# Altium project Smart_Charger_for_Single_cell_Li-ion_Battery.PrjPcb
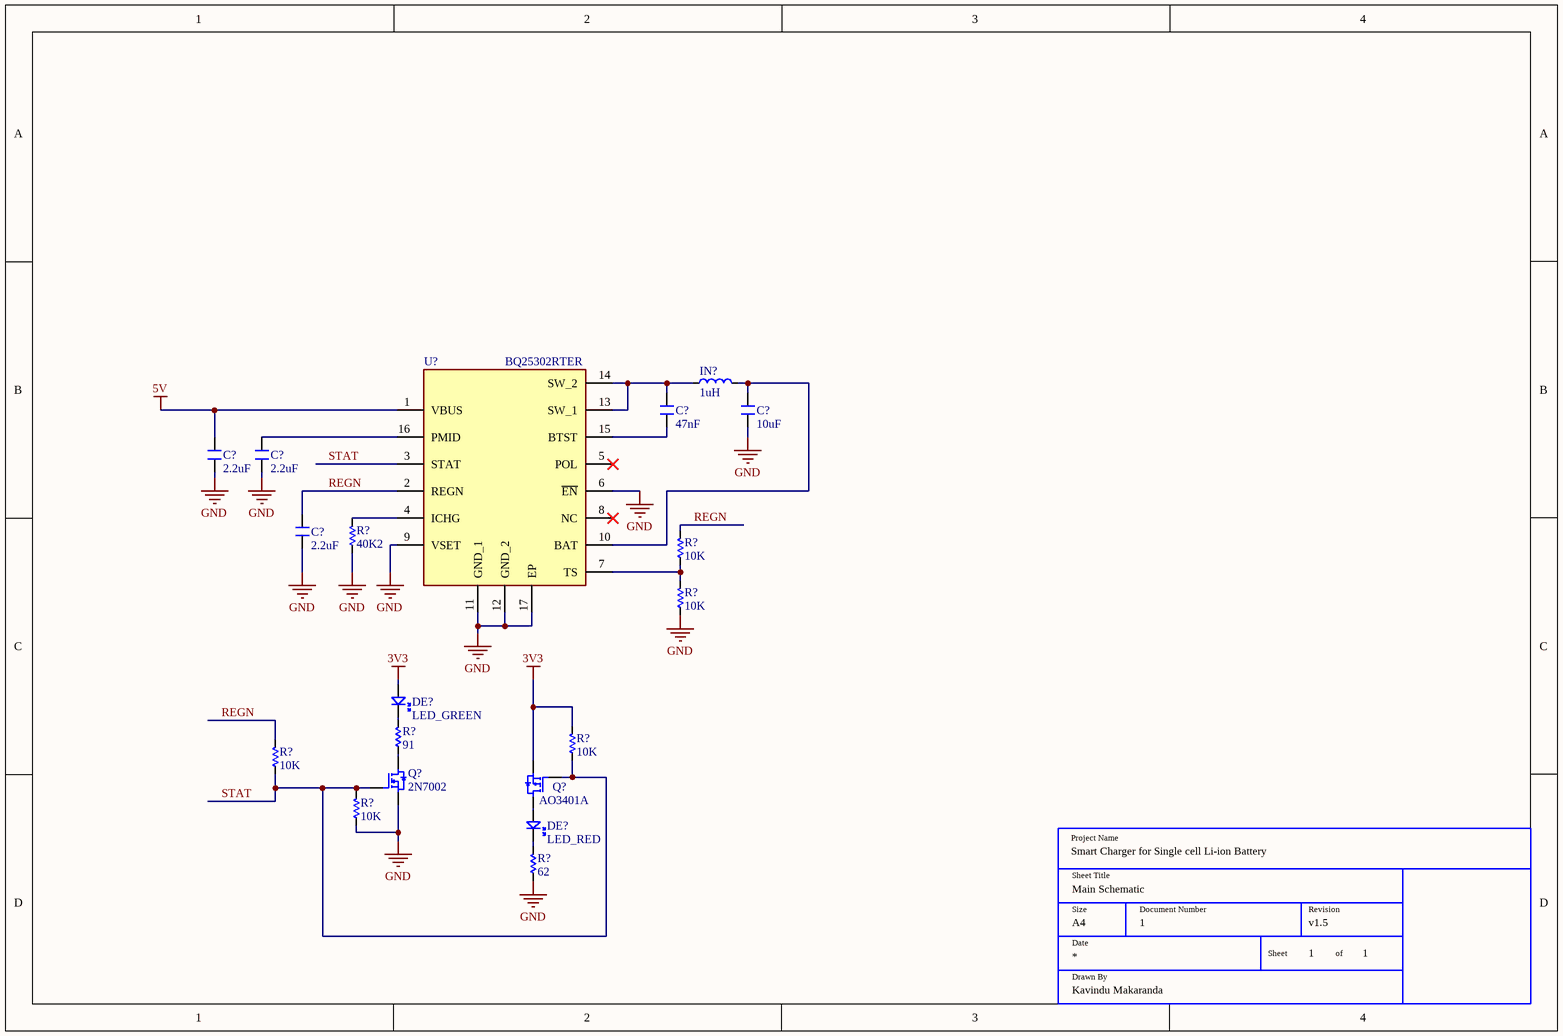
[diagram p0: Sheet1.SchDoc]
Project Name: Smart Charger for Single cell Li-ion Battery
1 sheet, 20 parts. Net scope: global (net labels, ports and power ports of the same name join across sheets).
Board file: PCB.PcbDoc

## Sheet Sheet1.SchDoc: Main Schematic
size A4; DrawnBy: Kavindu Makaranda; DocumentNumber: 1; Revision: v1.5; SheetNumber: 1; SheetTotal: 1; SheetSize: A4

### Parts
(Parts that share a designator on the sheet are numbered #1, #2 ... from top to bottom, then left to right.)
*  Title Box  (value not drawn)  (graphical)
C?#1  47nF  [CAPC1608X08N]
C?#2  10uF  [CAPC2012X14N]
C?#3  2.2uF  [CAPC2012X12N]
C?#4  2.2uF  [CAPC2012X12N]
C?#5  2.2uF  [CAPC2012X12N]
DE?#1  LED_GREEN  [LED_1608X06N]
DE?#2  LED_RED  [LED_1608X06N]
IN?  1uH  [INDC2520X09N]
Q?#1  AO3401A  [SOT95P240X115-3N]
Q?#2  2N7002  [SOT95P240X115-3N]
R?#1  40K2  [RESC1005X04N]
R?#2  10K  [RESC1005X04N]
R?#3  10K  [RESC1005X04N]
R?#4  91  [RESC1005X04N]
R?#5  10K  [RESC1005X04N]
R?#6  10K  [RESC1005X04N]
R?#7  10K  [RESC1005X04N]
R?#8  62  [RESC1005X04N]
U?  BQ25302RTER  [QFN50P300X300X80_HS-17N]

### Nets
3V3: DE?#1.2(+) Q?#1.2(S) R?#5.2
5V: C?#3.2 U?.1(VBUS)
GND: C?#2.1 C?#3.1 C?#4.1 C?#5.1 Q?#2.2(S) R?#1.1 R?#3.1 R?#7.1 R?#8.1 U?.6(~{EN}) U?.9(VSET) U?.11(GND_1) U?.12(GND_2) U?.17(EP)
REGN: C?#5.2 R?#2.2 R?#6.2 U?.2(REGN)
STAT: Q?#1.1(G) Q?#2.1(G) R?#5.1 R?#6.1 R?#7.2 U?.3(STAT)
NetC?#1_1: C?#1.1 U?.15(BTST)
NetC?#1_2: C?#1.2 IN?.1 U?.13(SW_1) U?.14(SW_2)
NetC?#2_2: C?#2.2 IN?.2 U?.10(BAT)
NetC?#4_2: C?#4.2 U?.16(PMID)
NetDE?#1_1: DE?#1.1(-) R?#4.2
NetDE?#2_1: DE?#2.1(-) R?#8.2
NetDE?#2_2: DE?#2.2(+) Q?#1.3(D)
NetQ?#2_3: Q?#2.3(D) R?#4.1
NetR?#1_2: R?#1.2 U?.4(ICHG)
NetR?#2_1: R?#2.1 R?#3.2 U?.7(TS)

Not connected (* = marked no-connect by the designer): U? 5(POL)* 8(NC)*

### Notes on the sheet
- (in symbol Title Box) Project Name; Sheet Title; Size; Document Number; Revision; Date; Sheet; of; Drawn By

### Library data of the parts
C?#1 = CC0603_47nF_X7R: C519546, CC0603JRX7R8BB473, 25V 47nF X7R ±5% 0603 Multilayer Ceramic Capacitors MLCC - SMD/SMT ROHS; Supplier 1: element14 APAC; Supplier Part Number 1: CC0603JRX7R8BB473
C?#2 = CC0805_10uF_X7R: C95841, CL21B106KOQNNNE,  10uF 16V X7R ±10% 0805 Multilayer Ceramic Capacitors MLCC - SMD/SMT ROHS; Supplier 1: Future Electronics; Supplier Part Number 1: CL21B106KOQNNNE
C?#3-C?#5 = CC0805_2.2uF_X7R: C19110 ,CL21B225KAFNNNE, 2.2uF 25V X7R ±10% 0805 Multilayer Ceramic Capacitors MLCC - SMD/SMT ROHS; Supplier 1: Avnet; Supplier Part Number 1: CL21B225KAFNNNE
DE?#1 = LED_0603_GREEN: C7496818, F.0603.00025/P2-0603G1TS2-06T-002, -40℃~+85℃ 120° 2.6V~2.9V 230mcd 30mA 517nm 520nm~525nm 90mW Discrete Diode Emerald Green 0603 LED Indication - Discrete ROHS; Supplier 1: element14 APAC; Supplier Part Number 1: 150060GS75000
DE?#2 = LED_0603_RED: C965799, XL-1608SURC-06, -40℃~+85℃ 120° 2.3V 20mA 225mcd 50mW 620nm~630nm 625nm Discrete Diode Red Top-mount Water Clear 0603 LED Indication - Discrete ROHS; Supplier 1: UnikeyIC; Supplier Part Number 1: XL-1608SURC-06
IN? = IN1008_1uH: C162587, LQM2HPN1R0MGHL, 1uH 2A 2A 50MHz 50mΩ Multilayer inductor ±20% 1008 Inductors (SMD) ROHS; Supplier 1: TTI; Supplier Part Number 1: LQM2HPN1R0MGHL
Q?#1 = AO3401A_SOT_23: C347476, AO3401A, -55℃~+150℃ 1 P-Channel 1.3V 1.4W 115pF 30V 4.2A 50mΩ@10V 77pF 9.4nC@4.5V 954pF P-Channel SOT-23 MOSFETs ROHS; Supplier 1: UnikeyIC; Supplier Part Number 1: AO3401A
Q?#2 = 2N7002_SOT_23: C916396, 2N7002, -55℃~+150℃ 1 N-channel 1.7Ω@5V 115mA 2.5V 200mW 50pF 5pF 60V SOT-23 MOSFETs ROHS; Supplier 1: LCSC; Supplier Part Number 1: C916396
R?#1 = RESC0402_40K2_THICK: C137983, RC0402FR-0740K2L, -55℃~+155℃ 40.2kΩ 50V 62.5mW Thick Film Resistor ±1% ±100ppm/℃ 0402 Chip Resistor - Surface Mount ROHS; Supplier 1: element14 APAC; Supplier Part Number 1: RC0402FR-0740K2L
R?#2 R?#3 R?#5-R?#7 = RESC0402_10K_THICK: C60490, RC0402FR-0710KL, -55℃~+155℃ 10kΩ 50V 62.5mW Thick Film Resistor ±1% ±100ppm/℃ 0402 Chip Resistor - Surface Mount ROHS; Supplier 1: element14 APAC; Supplier Part Number 1: RC0402FR-0710KL
R?#4 = RESC0402_91_THICK: C2998110, FRC0402F91R0TS, -55℃~+155℃ 50V 62.5mW 91Ω Thick Film Resistor ±1% ±100ppm/℃ 0402 Chip Resistor - Surface Mount ROHS; Supplier 1: UnikeyIC; Supplier Part Number 1: FRC0402F91R0TS
R?#8 = RESC0402_62_THICK: C274896, RC0402FR-0762RL, -55℃~+155℃ 50V 62.5mW 62Ω Thick Film Resistor ±1% ±100ppm/℃ 0402 Chip Resistor - Surface Mount ROHS; Supplier 1: element14 APAC; Supplier Part Number 1: RC0402FR-0762RL
U? = BQ25302RTER: C2761617, BQ25302RTER, -40℃~+85℃ 1 2A 4.4V 4uA 6.2V Charging IC Lithium Battery Support WQFN-16-EP(3x3) Battery Management ROHS; Manufacturer_Name: Texas Instruments; Datasheet Link: https://www.ti.com/lit/gpn/bq25302?HQS=ti-null-null-sf-df-pf-sep-wwe&DCM=yes; Height: 0.8mm; Manufacturer_Part_Number: BQ25302RTER; Mouser Part Number: 595-BQ25302RTER; Mouser Price/Stock: https://www.mouser.co.uk/ProductDetail/Texas-Instruments/BQ25302RTER?qs=T94vaHKWudT5T0v43I60Mg%3D%3D; Arrow Part Number: BQ25302RTER; Arrow Price/Stock: null?region=nac; Supplier 1: Mouser; Supplier Part Number 1: 595-BQ25302RTER; Supplier 2: Mouser; Supplier Part Number 2: 595-BQ25302RTER